# EasyEDA Pro project alcometerLayout_v2.epro

# Board PCB_ESP32 Tutorial
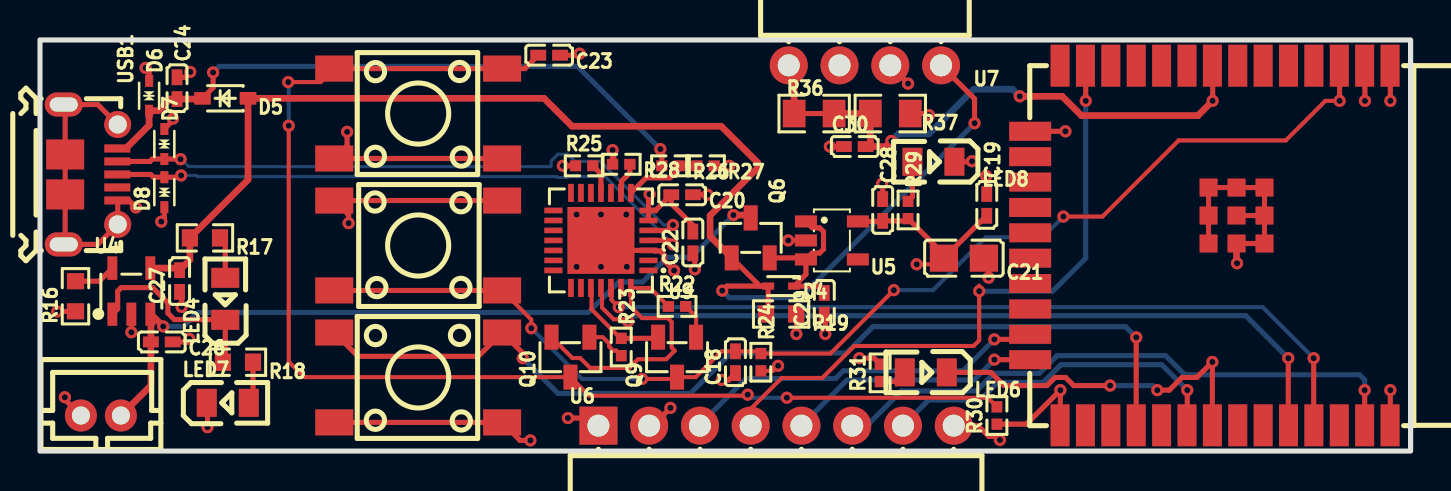
[diagram p0: board, top side]
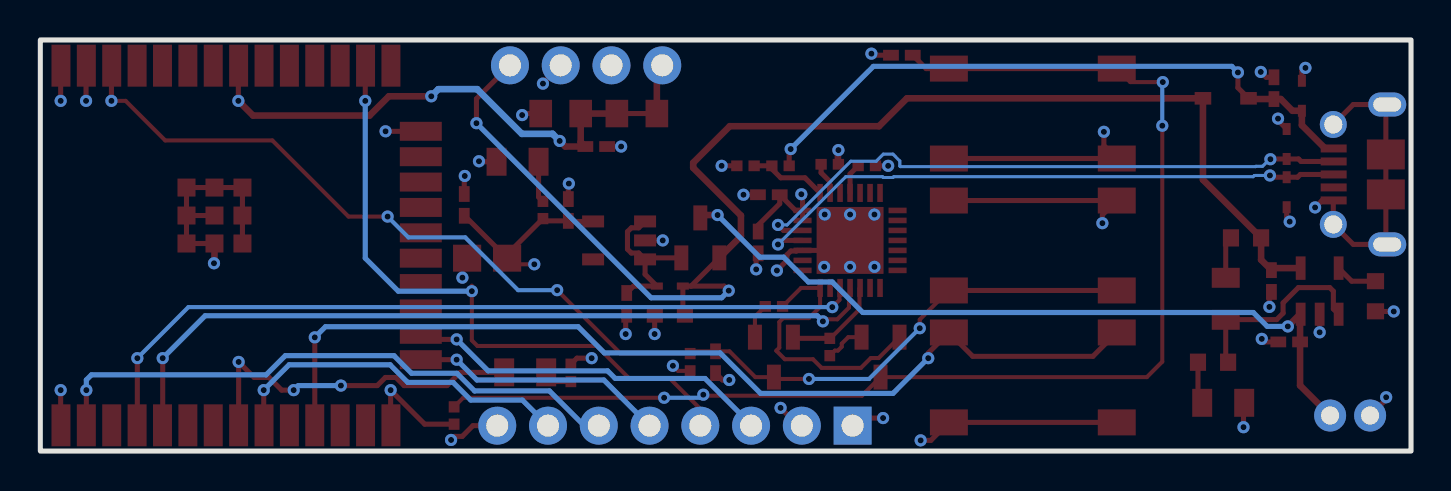
[diagram p1: board, bottom side, seen from below]

Outline 68.58 x 20.57 mm; copper layers: Top Layer, Inner1, Inner2, Bottom Layer. Coordinates in mm from the lower left corner of the outline.
Outline path: rectangle 0,20.57 68.58,0
Stack: Top Layer 0.035mm Outer layer thickness 1oz / Dielectric1 0.2104mm 7628 RC49% 8.6mil / Inner1 0.0152mm Inner layer thickness / Dielectric2 1.065mm 1.1mm H/HOZ Copper / Inner2 0.0152mm Inner layer thickness / Dielectric3 0.2104mm 7628 RC49% 8.6mil / Bottom Layer 0.035mm Outer layer thickness 1oz

## Design rules (mm)
template: User Custom Config
spacing Default (default): track to track 0.203, other pairs 0 to 0.203
spacing USB: track to track 0.152, other pairs 0 to 0.203
track width Default (default): min 0.203, default 0.203, max 25.4
track width USB: min 0.152, default 0.152, max 25.4
differential pair differentialPair (default): width min 0.127, default 0.254, max 2.54; gap min 0.152, default 0.152
via Default (default): diameter min 0.61, default 0.61, max 100.025; hole min 0.305, default 0.305, max 59.995
via USB: diameter min 0.61, default 0.61, max 100.025; hole min 0.305, default 0.305, max 59.995
net USB_DN uses USB
net USB_DP uses USB

## Placement (name value [footprint] x y rotation side)
C18  100nF  [C0402]  34.8 4.45 90 top
C19  100nF  [C0402]  47.37 12.32 270 top
C20  100nF  [C0402]  32.13 12.83 180 top
C21  22uF  [C0805]  46.23 9.65 180 top
C22  4.7uF  [C0402]  32.66 10.44 90 top
C23  100nF  [C0402]  25.48 19.81 180 top
C24  100nF  [C0402]  6.86 18.16 270 top
C26  10uF  [C0402]  6.1 5.46 180 top
C27  10uF  [C0402]  6.98 8.51 90 top
C28  10uF  [C0402]  42.16 12.07 270 top
C29  10uF  [C0402]  39.24 7.37 90 top
C30  100nF  [C0402]  40.77 15.24 0 top
CN1  B2B-PH-K-S(LF)(SN)  [CONN-TH_B2B-PH-K-S]  3.05 1.78 0 top
D4  RB521S30T1G  [SOD-523_L1.2-W0.8-LS1.6-RD]  37.08 8.26 180 top
D5  BAT760-7  [SOD-323_L1.7-W1.3-LS2.6-FD-1]  9.27 17.65 180 top
D6  LESD5D5.0CT1G  [SOD-523_L1.2-W0.8-LS1.6-BI]  5.46 17.78 270 top
D7  LESD5D5.0CT1G  [SOD-523_L1.2-W0.8-LS1.6-BI]  6.22 15.37 270 top
D8  LESD5D5.0CT1G  [SOD-523_L1.2-W0.8-LS1.6-BI]  6.22 12.95 90 top
LED4  KT-0805R  [LED0805-R-RD]  9.27 7.62 90 top
LED6  NCD0805R1  [LED0805-R-RD]  44.32 3.94 180 top
LED7  KT-0805G  [LED0805-R-RD]  9.4 2.41 0 top
LED8  KT-0805G  [LED0805-R-RD]  44.7 14.48 180 top
Q6  AO3401  [SOT-23-3_L2.9-W1.3-P0.95-LS2.4-BR]  35.56 10.67 270 top
Q9  SS8050-G(RANGE:120-200)  [SOT-23-3_L2.9-W1.3-P1.90-LS2.4-BR]  31.88 4.7 90 top
Q10  SS8050-G(RANGE:120-200)  [SOT-23-3_L2.9-W1.3-P1.90-LS2.4-BR]  26.54 4.7 90 top
R16  3K  [R0603]  1.78 7.75 90 top
R17  1K  [R0603]  8.25 10.67 180 top
R18  1K  [R0603]  9.91 4.45 180 top
R19  100K  [R0603]  37.08 6.86 180 top
R22  10kΩ  [R0402]  31.88 7.24 0 top
R23  10kΩ  [R0402]  29.08 5.21 270 top
R24  10kΩ  [R0402]  36.07 4.45 270 top
R25  10kΩ  [R0402]  27.23 14.28 0 top
R26  22.1kΩ  [R0402]  31.55 14.28 180 top
R27  47.5kΩ  [R0402]  33.3 14.28 180 top
R28  1kΩ  [R0402]  29.08 14.35 180 top
R29  5.1kΩ  [R0402]  43.43 12.07 270 top
R30  22Ω  [R0402]  47.88 1.78 90 top
R31  560Ω  [R0402]  42.04 3.91 90 top
R36  13kΩ  [R0805]  38.73 16.89 0 top
R37  20kΩ  [R0805]  42.54 16.89 180 top
SW4  TS-1002S-05026C  [KEY-SMD_4P-L6.0-W6.0-P4.50-LS9.0]  18.92 10.29 180 top
SW5  TS-1002S-05026C  [KEY-SMD_4P-L6.0-W6.0-P4.50-LS9.0]  18.92 16.89 0 top
SW7  TS-1002S-05026C  [KEY-SMD_4P-L6.0-W6.0-P4.50-LS9.0]  18.92 3.68 0 top
U4  MCP73831T-2ACI/OT  [SOT-23-5_L3.0-W1.7-P0.95-LS2.8-BL]  4.57 8 0 top
U5  ME6217C33M5G  [SOT-23-5_L3.0-W1.7-P0.95-LS2.8-BR]  39.62 10.54 180 top
U6  PM254-1-08-W-8.5  [HDR-TH_8P-P2.54-H-F-W10.0-N]  36.83 1.27 0 top
U7  PM254-1-04-W-8.5  [HDR-TH_4P-P2.54-H-F-W10.0-N]  41.28 19.3 180 top
U8  ESP32-WROOM-32E-N8  [WIFI-SMD_ESP32-WROOM-32E]  58.55 10.29 180 top
U9  CP2102N-A02-GQFN28R  [QFN-28_L5.0-W5.0-P0.50-TL-EP3.3]  28.07 10.54 180 top
USB1  1050170001  [MICRO-USB-SMD_105017-0001]  2.54 13.84 270 top

## Footprints (pads in the part's own frame, mm; a bottom-side part is the same pattern mirrored in y, then rotated)
C0402
  rect 0.79x0.54 smd: 1(-0.545,0) 2(0.545,0)
C0805
  rect 1.41x1.35 smd: 1(-1,0) 2(1,0)
CONN-TH_B2B-PH-K-S
  round 1.6 hole 0.9: 1(1,0) 2(-1,0)
HDR-TH_4P-P2.54-H-F-W10.0-N
  round 1.9 hole 1.1: 1(-3.81,0) 2(-1.27,0) 3(1.27,0) 4(3.81,0)
HDR-TH_8P-P2.54-H-F-W10.0-N
  rect 1.9x1.9 hole 1.1: 1(-8.89,0)
  round 1.9 hole 1.1: 2(-6.35,0) 3(-3.81,0) 4(-1.27,0) 5(1.27,0) 6(3.81,0) 7(6.35,0) 8(8.89,0)
KEY-SMD_4P-L6.0-W6.0-P4.50-LS9.0
  rect 1.9x1.3 smd: 1(-4.2,2.25) 2(4.2,2.25) 3(-4.2,-2.25) 4(4.2,-2.25)
LED0805-R-RD
  rect 1x1.399 smd: 1(1.05,0) 2(-1.05,0)
MICRO-USB-SMD_105017-0001
  rect 0.4x1.3 smd: 1(-1.3,1.33) 2(-0.65,1.33) 3(0,1.33) 4(0.65,1.33) 5(1.3,1.33)
  round 1.35 hole 0.9: 6(-2.5,1.35) 7(2.5,1.35)
  oval 1.2x1.9 hole 0.7x1.4: 8(3.5,-1.35) 9(-3.5,-1.35)
  rect 1.5x1.9 smd: 10(-1,-1.28) 10(1,-1.28)
QFN-28_L5.0-W5.0-P0.50-TL-EP3.3
  rect 0.905x0.28 smd: 1(-2.377,1.5) 2(-2.377,1) 3(-2.377,0.5) 4(-2.377,0) 5(-2.377,-0.5) 6(-2.377,-1) 7(-2.377,-1.5) 15(2.377,-1.5) 16(2.377,-1) 17(2.377,-0.5) 18(2.377,0) 19(2.377,0.5) 20(2.377,1) 21(2.377,1.5)
  rect 0.28x0.905 smd: 8(-1.5,-2.377) 9(-1,-2.377) 10(-0.5,-2.377) 11(0,-2.377) 12(0.5,-2.377) 13(1,-2.377) 14(1.5,-2.377) 22(1.5,2.377) 23(1,2.377) 24(0.5,2.377) 25(0,2.377) 26(-0.5,2.377) 27(-1,2.377) 28(-1.5,2.377)
  rect 3.35x3.35 smd: 29(0,0)
R0402
  rect 0.566x0.54 smd: 1(-0.433,0) 2(0.433,0)
R0603
  rect 0.806x0.864 smd: 1(-0.753,0) 2(0.753,0)
R0805
  rect 1.133x1.377 smd: 1(-1,0) 2(1,0)
SOD-323_L1.7-W1.3-LS2.6-FD-1
  rect 0.83x0.63 smd: 1(-1.14,0) 2(1.14,0)
SOD-523_L1.2-W0.8-LS1.6-BI
  rect 0.6x0.4 smd: 1(-0.75,0) 2(0.75,0)
SOD-523_L1.2-W0.8-LS1.6-RD
  rect 0.6x0.36 smd: 1(-0.65,0) 2(0.65,0)
SOT-23-3_L2.9-W1.3-P0.95-LS2.4-BR
  rect 1.25x0.7 smd: 1(1,-0.95) 2(1,0.95) 3(-1,0)
SOT-23-3_L2.9-W1.3-P1.90-LS2.4-BR
  rect 1.25x0.7 smd: 1(1,-0.95) 2(1,0.95) 3(-1,0)
SOT-23-5_L3.0-W1.7-P0.95-LS2.8-BL
  rect 0.49x1.157 smd: 1(-0.95,-1.153) 2(0,-1.153) 3(0.95,-1.153)
  rect 0.49x1.175 smd: 4(0.95,1.153) 5(-0.95,1.153)
SOT-23-5_L3.0-W1.7-P0.95-LS2.8-BR
  rect 1.1x0.6 smd: 1(1.3,-0.95) 2(1.3,0) 3(1.3,0.95) 4(-1.3,0.95) 5(-1.3,-0.95)
WIFI-SMD_ESP32-WROOM-32E
  rect 0.95x2.1 smd: 1(-9.002,-9) 2(-7.732,-9) 3(-6.463,-9) 4(-5.192,-9) 5(-3.922,-9) 6(-2.652,-9) 7(-1.383,-9) 8(-0.113,-9) 9(1.157,-9) 10(2.428,-9) 11(3.697,-9) 12(4.968,-9) 13(6.237,-9) 14(7.508,-9) 25(7.508,9) 26(6.237,9) 27(4.968,9) 28(3.697,9) 29(2.428,9) 30(1.157,9) 31(-0.113,9) 32(-1.383,9) 33(-2.652,9) 34(-3.922,9) 35(-5.192,9) 36(-6.463,9) 37(-7.732,9) 38(-9.002,9)
  rect 2.1x0.95 smd: 15(9.002,-5.715) 16(9.002,-4.445) 17(9.002,-3.175) 18(9.002,-1.905) 19(9.002,-0.635) 20(9.002,0.635) 21(9.002,1.905) 22(9.002,3.175) 23(9.002,4.445) 24(9.002,5.715)
  rect 0.9x0.9 smd: 39(-2.721,-0.1) 39(-2.721,-1.5) 39(-2.721,-2.9) 39(-1.321,-0.1) 39(-1.321,-1.5) 39(-1.321,-2.9) 39(0.079,-0.1) 39(0.079,-1.5) 39(0.079,-2.9)

## Nets
+3V3: C19.2 C20.2 C21.2 C22.2 C28.2 R24.2 R28.2 R29.2 R31.2 U5.5 U6.1 U6.8 U8.2 U9.6 U9.7
+5V_VBUS: C24.2 D5.2 D6.2 R26.2 USB1.1
GND: C18.1 C19.1 C20.1 C21.1 C22.1 C23.1 C24.1 C26.1 C27.1 C28.1 C29.1 C30.1 CN1.2 D6.1 D7.1 D8.1 LED7.2 LED8.2 R16.1 R19.1 R25.1 R27.1 R37.1 SW4.3 SW4.4 SW5.3 SW5.4 SW7.3 SW7.4 U4.2 U5.2 U6.2 U7.2 U8.1 U8.15 U8.38 U8.39 U9.3 U9.29 USB1.5 USB1.6 USB1.7 USB1.8 USB1.9 USB1.10
VBAT: C26.2 CN1.1 Q6.3 U4.3
DTR: Q10.2 R22.1 U9.28
EN: C18.2 Q9.3 R24.1 SW4.1 SW4.2 U8.3
EXT_5V: C27.2 D4.2 D5.1 Q6.1 R17.2 R19.2 U4.4 U7.1
IO0: R30.1 U8.25
IO0_BTN: C23.2 Q10.3 R30.2 SW5.1 SW5.2
IO2: U6.5 U8.24
IO14: U6.4 U8.13
IO15: U6.3 U8.23
IO17: SW7.1 SW7.2 U8.28
IO18: U6.7 U8.30
IO19: LED6.2 U8.31
IO23: U6.6 U8.37
IO32: C30.2 R36.1 R36.2 R37.2 U7.4 U8.8
RTS: Q9.2 R23.1 U9.24
RXD: U8.34 U9.25
STAT: LED4.2 R18.2 U4.1
TXD: U8.35 U9.26
USB_DN: D7.2 U9.5 USB1.2
USB_DP: D8.2 U9.4 USB1.3
$1N43: R28.1 U9.9
$1N45: R25.2 U9.11
$1N47: R26.1 R27.2 U9.8
$1N69: Q9.1 R22.2
$1N70: Q10.1 R23.2
$1N80: LED8.1 R29.1
$1N127: LED6.1 R31.1
$1N2941: R16.2 U4.5
$1N3078: LED4.1 R17.1
$1N3304: LED7.1 R18.1
$1N4537: C29.2 D4.1 Q6.2 U5.1 U5.3

Pads without a net: U5 4; U7 3; U8 4 5 6 7 9 10 11 12 14 16 17 18 19 20 21 22 26 27 29 32 33 36; U9 1 2 10 12 13 14 15 16 17 18 19 20 21 22 23 27; USB1 4

## Via types
v1: diameter 0.61, hole 0.305, Top Layer to Bottom Layer, 88 vias

## Routing (per net, layer and track width the routed paths; a pad name or vN(x,y) marks a point on that pad's centre or on a via; arc(x,y) is an arc through that point)
+3V3: length 23.8
  Top Layer w0.203: v1(43.87,9.35) 44.92,9.35 C21.2 ; v1(36.93,4.27) 36.68,4.01 R24.2
  Top Layer w0.254: C22.2 32.66,11.3 31.59,12.38 C20.2 30.8,12.04 U9.7 ; R31.2 41.73,4.65 v1(41,4.65) ; v1(66.29,17.53) 66.29,19.27 U8.2 ; U6.1 27.56,1.65 v1(26.42,1.65) ; v1(30.51,12.85) 30.44,12.79 U9.7 ; U9.7 U9.6 ; U6.8 46.93,1.27 47.47,0.73 47.85,0.73 v1(48.03,0.55) ; C19.2 47.35,11.77 C21.2 45.23,9.84 R29.2 43.32,11.52 C28.2 42.13,11.49 U5.5
  Top Layer w0.33: 28.68,14.35 28.68,15.04 v1(28.65,15.06)
+5V_VBUS: length 32.3
  Top Layer w0.254: v1(8.66,18.95) 8.66,18.18 D5.2 ; R26.2 31.11,15.04 v1(31.04,15.11)
  Top Layer w0.33: D5.2 8.09,17.62 C24.2 6.52,17.62 5.93,17.03 D6.2 5.46,16.31 4.3,15.14 USB1.1
  Bottom Layer w0.254: v1(31.04,15.11) 26.9,19.25 8.97,19.25 v1(8.66,18.95)
GND: length 92.3
  Top Layer w0.254: U4.2 v1(4.57,5.94) ; v1(43.43,18.39) 43.43,18.42 42.54,19.3 ; v1(7.47,5.61) 7.31,5.46 C26.1 ; v1(24.54,0.53) 24.02,0.53 SW7.4 14.72,1.43 ; SW5.4 14.72,14.64 15.37,15.29 v1(15.37,15.98) ; v1(8.38,1.19) 8.38,2.38 LED7.2 ; v1(32.77,9.09) 32.77,9.79 C22.1 ; U8.1 67.56,19.27 v1(67.56,17.53) ; C20.1 v1(33.4,12.83) ; R19.1 37.85,6.85 v1(37.85,5.86) ; C21.1 47.46,9.42 v1(47.46,8.68) ; C28.1 42.16,13.36 v1(42.14,13.39) ; U8.38 67.56,1.3 v1(67.56,3.05) ; USB1.6 2.89,17.34 USB1.9 1.26,17.27 USB1.10 USB1.10 1.26,10.41 USB1.8 2.89,10.34 USB1.7 3.89,12.52 USB1.5 4.45,12.54 v1(4.8,12.19) ; R27.1 v1(34.49,14.28) ; U6.2 30.66,1.27 v1(31.54,2.16) ; R37.1 44.4,16.89 v1(44.48,16.82) ; U8.39 U8.39 U8.39 ; v1(1.24,2.69) 1.24,2.58 CN1.2 ; D7.1 6.66,16.55 v1(6.66,16.64) ; U5.2 v1(37.44,10.54) 37.41,10.57 ; SW4.3 14.72,12.54 15.44,11.82 v1(15.44,11.4) ; C18.1 34.45,3.56 v1(34.11,3.56) ; C27.1 7.09,7.86 v1(7.09,7.21) ; 26.02,19.81 26.92,19.81 v1(27,19.89) ; U8.39 U8.39 U8.39 U8.39 U8.39 U8.39 ; U8.39 59.87,11.79 ; LED8.2 46.61,14.48 v1(46.63,14.5) ; R25.1 v1(26.16,14.28) ; U9.29 28.57,10.04 U9.3 30.72,10.04 30.75,10.01 31.03,10.01 31.23,9.82 31.23,9.54 v1(31.73,9.04) ; v1(0.86,6.99) 1.77,6.99 R16.1 ; 39.24,6.82 39.29,6.77 v1(39.29,5.86) ; C24.1 7.25,18.71 v1(7.52,18.97) ; U8.15 v1(51.31,16) ; C19.1 47.37,13.74 v1(47.35,13.77) ; v1(6.07,11.48) 6.22,11.63 D8.1 ; v1(5.28,19.18) 5.46,19 D6.1 ; C30.1 v1(39.52,15.24)
  Top Layer w0.33: v1(59.89,9.4) 59.87,9.42 U8.39
  vias: v1(26.85,11.84) v1(26.85,9.22) v1(28.07,11.84) v1(28.07,9.22) v1(29.34,11.84) v1(29.36,9.22)
VBAT: length 38.4
  Top Layer w0.33: v1(34.7,11.81) 35.42,11.81 Q6.3 ; v1(6.16,6.24) 5.55,6.85 U4.3 5.55,6.82 C26.2 5.55,3.28 CN1.1
  Bottom Layer w0.254: v1(6.16,6.24) 7.19,6.24 7.89,6.93 27.43,6.93 28.96,8.46 30.15,8.46 31.39,9.7 32.59,9.7 v1(34.7,11.81)
DTR: length 14.2
  Top Layer w0.203: 25.59,5.7 26.64,4.65 27.03,4.65 27.52,4.16 29.49,4.16 29.92,4.6 31.33,4.6 31.75,5.01 31.75,5.03 31.61,5.17 31.61,6.46 31.41,6.65 30.12,6.65 29.57,7.21 U9.28 30.52,8.16 R22.1
EN: length 60
  Top Layer w0.203: v1(24.58,6.15) 24.58,6.58 SW4.1 ; v1(65.02,17.53) 64.31,17.53 62.33,15.55 56.97,15.55 53.16,11.74 v1(51.21,11.74) ; v1(30.12,3.61) 31.78,3.61 Q9.3 32.81,3.7 34.1,4.99 C18.2 35.96,4.99 R24.1 39.55,4.88 v1(42.72,8.05)
  Top Layer w0.254: v1(65.02,17.53) 65.02,19.27 U8.3 ; 14.72,8.04 SW4.1
  Bottom Layer w0.203: v1(51.21,11.74) 50.16,10.69 47.32,10.69 44.68,8.05 v1(42.72,8.05) ; v1(24.58,6.15) 27.12,3.61 v1(30.12,3.61)
EXT_5V: length 70.4
  Top Layer w0.254: Q6.1 36.02,8.26 ; 36.02,8.26 D4.2 36.43,6.96 R19.2 ; 36.02,8.26 34.37,8.26 v1(34.14,8.03) ; v1(46.76,16.41) 46.76,17.63 U7.1
  Top Layer w0.33: U4.4 6.88,9.15 C27.2 7.5,9.57 R17.2 10.41,13.58 D5.1 25.22,17.65 26.62,16.26 34.09,16.26 35.92,14.43 35.92,14.17 33.53,11.79 33.53,10.75 Q6.1
  Bottom Layer w0.254: v1(34.14,8.03) 34.49,7.67 38.02,7.67 v1(46.76,16.41)
IO0: length 5.6
  Top Layer w0.254: U8.25 51.05,1.3 v1(51.05,3.05) 49.35,1.35 47.88,1.35
IO0_BTN: length 63.5
  Top Layer w0.203: v1(35.41,2.82) 35.36,2.77 27.47,2.77 Q10.3 13.22,3.7 12.45,4.47 v1(12.45,16.28) ; v1(37.37,2.67) 47.42,2.67 R30.2 ; v1(12.42,18.47) 14.05,18.47 14.72,19.14
  Top Layer w0.254: 14.72,19.14 SW5.2 24.26,19.14 C23.2
  Bottom Layer w0.203: v1(12.45,16.28) 12.45,18.44 v1(12.42,18.47) ; v1(37.37,2.67) 35.56,2.67 v1(35.41,2.82)
IO2: length 12.8
  Top Layer w0.254: U8.24 v1(47.75,4.57)
  Bottom Layer w0.254: U6.5 40.39,3.56 46.74,3.56 v1(47.75,4.57)
IO14: length 31.8
  Top Layer w0.203: 46.99,8.28 46.99,5.54 46.71,5.26 40.74,5.26 39.14,3.66 37.11,3.66 35.56,2.11 35.56,1.55
  Top Layer w0.254: 52.31,19.26 52.32,19.25 52.32,17.5
  Bottom Layer w0.254: v1(52.32,17.53) 52.32,9.65 50.67,8 v1(46.99,8)
IO15: length 18.5
  Top Layer w0.254: U8.23 49.29,5.59 v1(47.75,5.59)
  Bottom Layer w0.254: U6.3 33.02,1.33 35.32,3.63 39.82,3.63 40.2,4.01 46.18,4.01 v1(47.75,5.59)
IO17: length 48.5
  Top Layer w0.254: 14.72,5.93 15.91,4.74 21.93,4.74 SW7.2 24.16,4.9 v1(24.16,4.65) ; U8.28 v1(54.85,5.69)
  Bottom Layer w0.254: v1(24.16,4.65) 25.92,2.88 32.54,2.88 34.57,4.91 40.36,4.91 41.67,6.22 54.32,6.22 v1(54.85,5.69)
IO18: length 17.8
  Top Layer w0.254: v1(57.4,3.05) 57.4,1.3 U8.30
  Bottom Layer w0.254: U6.7 44.46,2.55 47.04,2.55 47.93,3.44 50.2,3.44 51.08,4.32 56.13,4.32 v1(57.4,3.05)
IO19: length 17.7
  Top Layer w0.254: LED6.2 47.57,3.94 48.23,3.28 50.38,3.28 50.79,3.68 51.32,3.68 51.72,3.28 v1(53.54,3.28) ; v1(55.91,3.05) 56.51,3.05 57.14,3.68 57.88,3.68 v1(58.66,4.46) U8.31
  Bottom Layer w0.254: v1(55.91,3.05) 55.68,3.28 v1(53.54,3.28)
IO23: length 29.9
  Top Layer w0.254: U8.37 v1(66.28,3.05)
  Bottom Layer w0.254: U6.6 41.37,1.27 43.11,3.01 46.85,3.01 47.74,3.89 50.01,3.89 50.89,4.78 56.32,4.78 57.28,3.81 66.03,3.81 66.28,3.56 v1(66.28,3.05)
IO32: length 29.3
  Top Layer w0.254: U8.8 58.67,19.27 v1(58.67,17.53) ; R36.2 R36.1
  Top Layer w0.33: v1(42.6,15.52) 42.32,15.24 C30.2 41.54,15.47 R37.2 R36.2 ; U7.4 37.73,19.03 R36.1 ; v1(49.02,17.75) 51.14,17.75 52.11,16.79 57.94,16.79 v1(58.67,17.53)
  Bottom Layer w0.33: v1(49.02,17.75) 48.67,18.11 46.72,18.11 44.49,15.88 42.95,15.88 v1(42.6,15.52)
RTS: length 5
  Top Layer w0.203: U9.24 27.6,8.13 27.6,7.09 29.05,5.64 R23.1
  Top Layer w0.254: R23.1 30.87,5.64 Q9.2
RXD: length 40
  Top Layer w0.203: v1(29.43,6.49) 29.32,6.59 28.7,6.59 28.12,7.18 28.12,7.8 28.07,7.85 U9.25
  Top Layer w0.254: v1(62.46,4.65) 62.46,1.3 U8.34
  Bottom Layer w0.254: v1(62.46,4.65) 60.34,6.77 29.71,6.77 v1(29.43,6.49)
STAT: length 9.9
  Top Layer w0.254: U4.1 3.89,7.11 3.89,8 4.07,8.18 5.64,8.18 6.4,7.42 6.4,6.9 6.72,6.58 9.26,6.58 LED4.2 9.27,4.56 R18.2
TXD: length 40.3
  Top Layer w0.203: U9.26 28.6,8.13 28.6,7.56 v1(28.96,7.2)
  Top Layer w0.254: U8.35 63.73,1.3 v1(63.73,4.65)
  Bottom Layer w0.203: v1(28.96,7.2) 61.17,7.2 v1(63.73,4.65)
USB_DN: length 31.2
  Top Layer w0.254: v1(31.67,11.32) 31.4,11.04 U9.5 ; USB1.2 5.5,14.49 5.63,14.62 D7.2 7.02,14.62 v1(7.04,14.61)
  Bottom Layer w0.152: v1(7.04,14.61) 7.07,14.61 7.43,14.25 7.76,14.25 7.77,14.23 25.55,14.23 25.58,14.26 25.58,14.52 25.92,14.86 26.4,14.86 26.76,14.5 28.03,14.5 31.22,11.32 v1(31.67,11.32)
USB_DP: length 30.7
  Top Layer w0.254: v1(7.06,13.79) 6.97,13.7 D8.2 5.68,13.7 5.54,13.84 USB1.3 ; v1(31.67,10.34) 31.47,10.54 U9.4
  Bottom Layer w0.152: v1(7.06,13.79) 7.84,13.79 7.9,13.73 25.88,13.73 25.92,13.69 26.4,13.69 26.44,13.73 28.28,13.73 v1(31.67,10.34)
$1N43: length 1.6
  Top Layer w0.254: R28.1 29.52,13.93 29.1,13.51 29.1,12.95 U9.9
$1N45: length 1.5
  Top Layer w0.254: R25.2 28.07,13.87 U9.11
$1N47: length 4
  Top Layer w0.254: U9.8 30.32,13.67 31.53,13.67 31.98,14.12 R26.1 R27.2
$1N69: length 1.8
  Top Layer w0.203: 32.83,5.7 32.83,6.72 R22.2
$1N70: length 2.1
  Top Layer w0.203: R23.2 28.83,5.03 28.68,5.03 28.48,5.22 28.48,5.37 28.16,5.7 Q10.1
$1N80: length 2.1
  Top Layer w0.254: R29.1 43.65,12.72 LED8.1
$1N127: length 1.4
  Top Layer w0.254: LED6.1 42.81,3.48 R31.1
$1N2941: length 2.1
  Top Layer w0.254: U4.5 2.97,8.5 R16.2
$1N3078: length 2.1
  Top Layer w0.254: R17.1 9.27,10.41 LED4.1
$1N3304: length 2.1
  Top Layer w0.254: R18.1 10.66,2.62 LED7.1
$1N4537: length 8.1
  Top Layer w0.254: U5.3 38.32,8.85 D4.1 38.9,8.26 C29.2 ; U5.3 38.64,9.91 39.01,9.91 39.2,10.1 39.2,10.98 39.01,11.17 38.64,11.17 U5.1 ; U5.3 38.25,9.67 Q6.2

## Copper pours and planes (outline as drawn; the poured copper is in the pictures)
+3V3 on Inner2: 45.24,2.96 46.2,2.96 46.2,1.74 45.24,1.74
+3V3 on Inner2: 26.25,1.75 27.47,1.75 27.47,0.79 26.25,0.79
+3V3 on Inner2: 46.19,1.75 47.41,1.75 47.41,0.79 46.19,0.79
+3V3 on Inner2: 27.46,2.96 28.42,2.96 28.42,1.74 27.46,1.74
+3V3 on Inner2: 0.21,20.37 68.37,20.37 68.37,0.21 0.21,0.21
GND on Inner1: 0.71,11.68 1.67,11.68 1.67,10.46 0.71,10.46
GND on Inner1: 42.07,18.84 43.02,18.84 43.02,17.62 42.07,17.62
GND on Inner1: 0.21,20.37 68.37,20.37 68.37,0.21 0.21,0.21
GND on Inner1: 0.71,17.23 1.67,17.23 1.67,16.01 0.71,16.01
GND on Inner1: 0.71,10.23 1.67,10.23 1.67,9.01 0.71,9.01
GND on Inner1: 0.71,18.68 1.67,18.68 1.67,17.46 0.71,17.46

Small or netless copper shapes (teardrops, artwork), in the pictures only: 13 on Inner1

## Text on the board
Top Silkscreen Layer: 1
